# Altium schematic sheet Sheet3.SchDoc
size A4; SheetNumber: 3; SheetTotal: 6
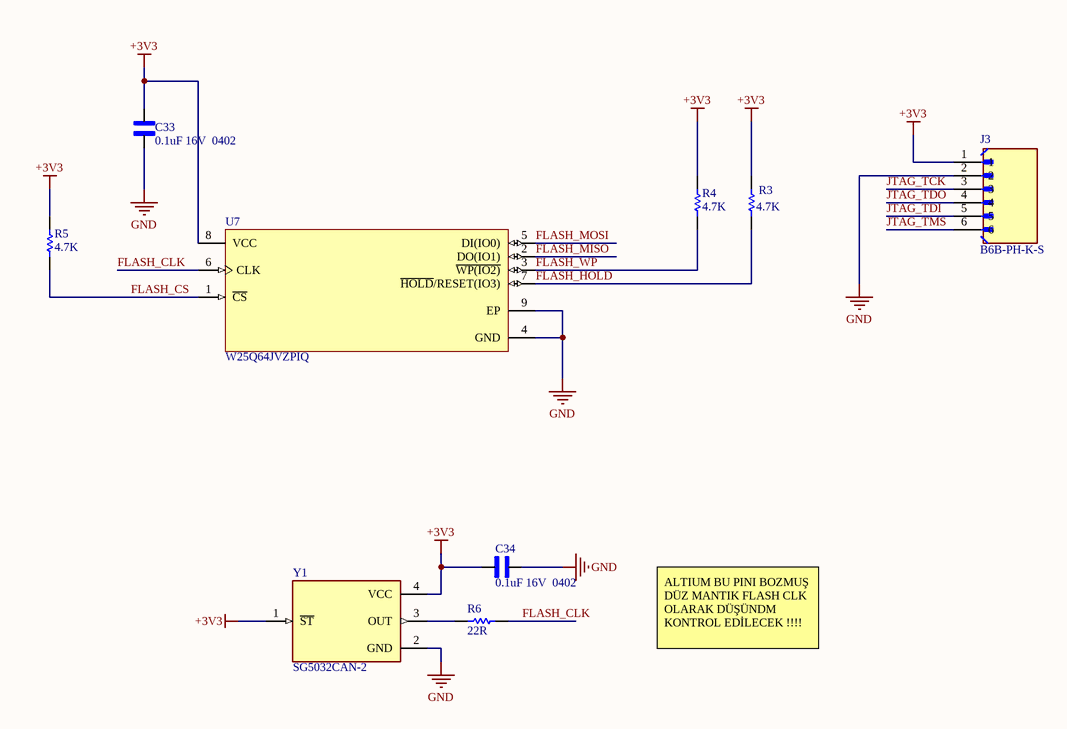
[diagram p0: Sheet3.SchDoc]

## Parts
C33  Parameter 1: 0.1uF 16V  0402  [0402]  (hidden comment: CC0402JRX7R7BB104)
C34  Parameter 1: 0.1uF 16V  0402  [0402]  (hidden comment: CC0402JRX7R7BB104)
J3  B6B-PH-K-S  [JST_B6B-PH-K-S]
R3  4.7K  [RESC1608X55X25LL10T15]
R4  4.7K  [RESC1608X55X25LL10T15]
R5  4.7K  [RESC1608X55X25LL10T15]
R6  22R  [RESC1608X55X25LL10T15]
U7  W25Q64JVZPIQ  [FP-ZP-MFG]
Y1  SG5032CAN-2  [SG5032CAN]

## Nets
+3V3: C33.2 C34.2 J3.1 R3.2 R4.2 R5.2 U7.8(VCC) Y1.1(~{ST}) Y1.4(VCC)
GND: C33.1 C34.1 J3.2 U7.4(GND) U7.9(EP) Y1.2(GND)
FLASH_CLK: R6.1 U7.6(CLK)
FLASH_CS: R5.1 U7.1(~{CS})
FLASH_HOLD: R3.1 U7.7(~{HOLD}/RESET(IO3))
FLASH_MISO: U7.2(DO(IO1))
FLASH_MOSI: U7.5(DI(IO0))
FLASH_WP: R4.1 U7.3(~{WP(IO2)})
JTAG_TCK: J3.3
JTAG_TDI: J3.5
JTAG_TDO: J3.4
JTAG_TMS: J3.6
NetR6_2: R6.2 Y1.3(OUT)

## Notes on the sheet
- ALTIUM BU PINI BOZMUŞ
  DÜZ MANTIK FLASH CLK OLARAK DÜŞÜNDM KONTROL EDİLECEK !!!!

## Library data of the parts
C33 C34 = CAP_CER_0402: CAP CER 0.1UF 16V X7R 0402
J3 = B6B-PH-K-S: Connector Header Through Hole 6 position 0.079 (2.00mm); MF: JST Sales; SnapEDA_Link: https://www.snapeda.com/parts/B6B-PH-K-S/JST+Sales+America+Inc./view-part/?ref=snap; Package: None; Value: *; MP: B6B-PH-K-S; Check_prices: https://www.snapeda.com/parts/B6B-PH-K-S/JST+Sales+America+Inc./view-part/?ref=eda
R3-R6 = CMP-2000-06928-1: Chip Resistor, 147 KOhm, +/- 1%, 0.1 W, -55 to 155 degC, 0603 (1608 Metric), RoHS, Tape and Reel; Manufacturer: Yageo; Temperature Coefficient: ±100ppm/°C; Power (Watts): 0.1W,1/10W; PCN Other: RC/AC0603/0805/120622/Jan/2013; Kits: PHH6-KIT-ND-RESKIT100K-1M1/10W5750PCS; EDA / CAD Models: DownloadfromAcceleratedDesigns; Online Catalog: RC0603Series; HTML Datasheet: RCSeries,LSuffixDatasheet.html; Resistance (Ohms): 147k; Catalog Drawings: ThickFilmResistorSide; Other Names: 311-147KHRCT; Product Training Modules: ChipResistor; Series: RC; Height: 0.022"(0.55mm); Number of Terminations: 2; Family: ChipResistor-SurfaceMount; Manufacturer URL: http://www.yageo.com/; Tolerance: ±1%; Operating Temperature: -55°C~155°C; Datasheet Version: Rev. 7, 05/2017; Standard Package: 1; Category: Resistors; Packaging: CutTape(CT); Size / Dimension: 0.063"Lx0.031"W(1.60mmx0.80mm); Datasheet URL: http://www.yageo.com/documents/recent/PYu-RC_Group_51_RoHS_L_7.pdf; Package / Case: 0603(1608Metric); Package Reference: 0603; Supplier Device Package: 0603; Composition: ThickFilm; Features: MoistureResistant; Mounting Technology: SurfaceMount; Package Description: 2-Pin Surface Mount Device, Body 1.6 x 0.8 mm
U7 = CMP-00619-80966617-1: W25Q64JVZPIQ NOR Flash Serial (SPI, Dual SPI, Quad SPI) 3V/3.3V 64M-bit 8M x 8 6ns 8-Pin WSON EP T/R/Tray/Tube; Memory Size: 8MB; Max Supply Voltage: 3.6V; Min Supply Voltage: 2.7V; Frequency: 133MHz; NexarPartId: 80966617; Memory Type: FLASH; Height: 800µm; Max Operating Temperature: 85°C; Interface: SPI; Ambient Temperature Range High: 85°C; Min Operating Temperature: -40°C; Schedule B: 8542320070, 8542320070; RoHS: Non-Compliant; Access Time: 6ns
Y1 = SG5032CAN-2: SG5032CAN